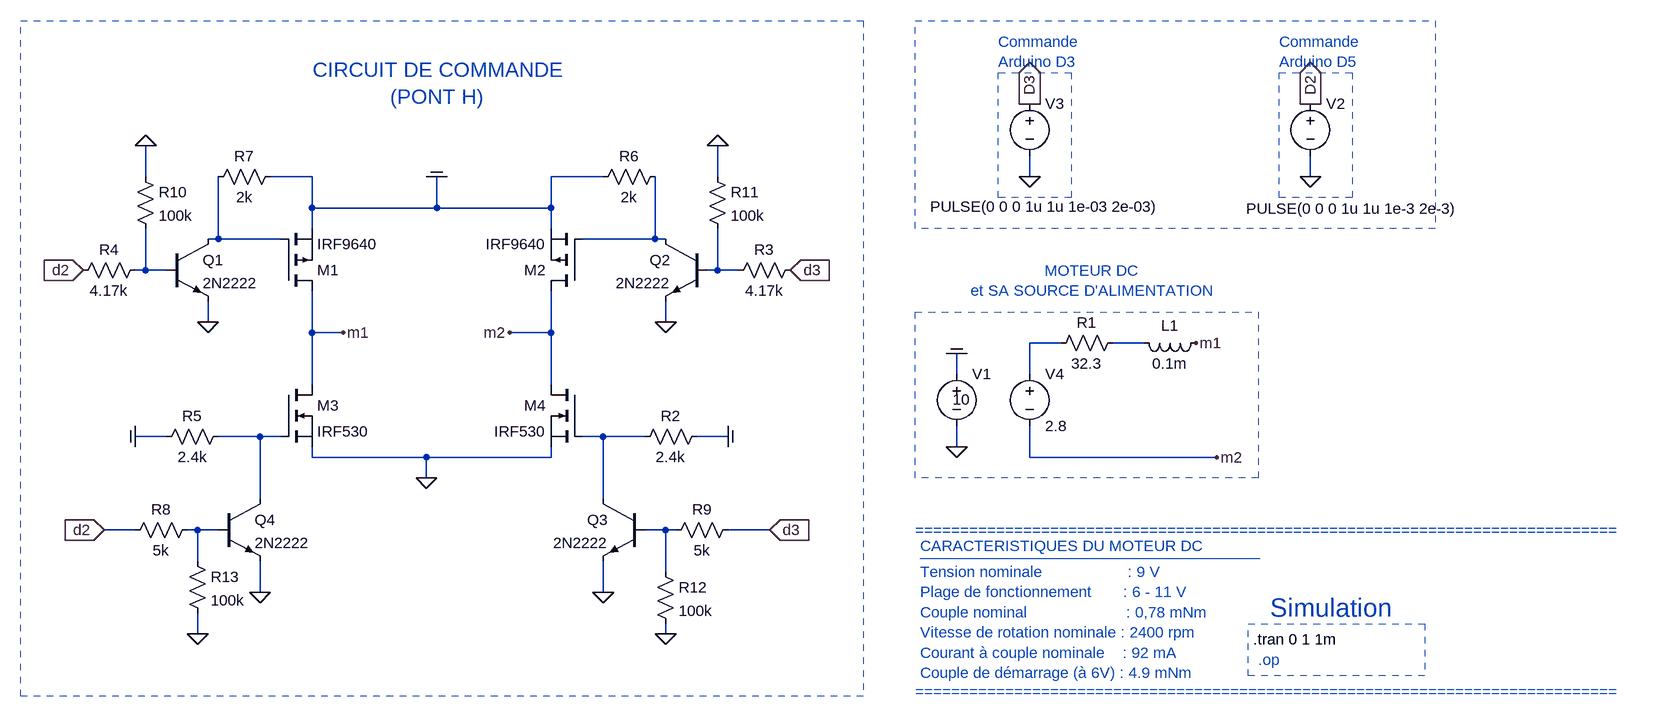
[diagram p0: schematic commande_moteur_DC_mosfet.asc]
commande_moteur_DC_mosfet.asc, the LTspice schematic file:
Version 4.1
SHEET 1 1636 1096
WIRE -432 -416 -432 -464
WIRE -176 -416 -240 -416
WIRE 272 -416 192 -416
WIRE 448 -416 448 -464
WIRE 928 -416 928 -448
WIRE 1360 -416 1360 -448
WIRE -176 -368 -176 -416
WIRE 16 -368 16 -416
WIRE 16 -368 -176 -368
WIRE 192 -368 192 -416
WIRE 192 -368 16 -368
WIRE -176 -336 -176 -368
WIRE 192 -336 192 -368
WIRE -320 -320 -320 -416
WIRE -320 -320 -336 -320
WIRE -224 -320 -320 -320
WIRE 352 -320 352 -416
WIRE 352 -320 240 -320
WIRE 368 -320 352 -320
WIRE -432 -272 -432 -336
WIRE -432 -272 -448 -272
WIRE -400 -272 -432 -272
WIRE 448 -272 448 -336
WIRE 448 -272 432 -272
WIRE 480 -272 448 -272
WIRE -336 -192 -336 -224
WIRE 368 -192 368 -224
WIRE -176 -176 -176 -240
WIRE -128 -176 -176 -176
WIRE 192 -176 192 -240
WIRE 192 -176 128 -176
WIRE 976 -160 928 -160
WIRE 1104 -160 1056 -160
WIRE 816 -112 816 -144
WIRE 928 -112 928 -160
WIRE -176 -96 -176 -176
WIRE 192 -96 192 -176
WIRE -400 -16 -448 -16
WIRE -256 -16 -320 -16
WIRE -224 -16 -256 -16
WIRE 272 -16 240 -16
WIRE 336 -16 272 -16
WIRE 464 -16 416 -16
WIRE 816 0 816 -32
WIRE -176 16 -176 0
WIRE 0 16 -176 16
WIRE 192 16 192 0
WIRE 192 16 0 16
WIRE 928 16 928 -32
WIRE 1216 16 928 16
WIRE 0 48 0 16
WIRE -256 80 -256 -16
WIRE 272 80 272 -16
WIRE -448 128 -496 128
WIRE -352 128 -368 128
WIRE -320 128 -352 128
WIRE 368 128 336 128
WIRE 384 128 368 128
WIRE 528 128 464 128
WIRE -352 176 -352 128
WIRE 368 192 368 128
WIRE -256 224 -256 176
WIRE 272 224 272 176
WIRE -352 288 -352 256
WIRE 368 288 368 272
FLAG 0 48 0
FLAG 816 0 0
FLAG 816 -144 COM
FLAG 16 -416 COM
FLAG -128 -176 m1
FLAG 128 -176 m2
FLAG 1184 -160 m1
FLAG 1216 16 m2
FLAG 1360 -416 0
FLAG 928 -416 0
FLAG 928 -528 D3
IOPIN 928 -528 Out
FLAG 1360 -528 D2
IOPIN 1360 -528 Out
FLAG -528 -272 d2
IOPIN -528 -272 In
FLAG 560 -272 d3
IOPIN 560 -272 In
FLAG -336 -192 0
FLAG 368 -192 0
FLAG -256 224 0
FLAG 272 224 0
FLAG 464 -16 COM
FLAG -448 -16 COM
FLAG 528 128 d3
IOPIN 528 128 In
FLAG -496 128 d2
IOPIN -496 128 In
FLAG -432 -464 0
FLAG 448 -464 0
FLAG -352 288 0
FLAG 368 288 0
SYMBOL nmos -224 -96 R0
SYMATTR InstName M3
SYMATTR Value IRF530
SYMBOL nmos 240 -96 M0
SYMATTR InstName M4
SYMATTR Value IRF530
SYMBOL voltage 816 -128 R0
WINDOW 3 -6 55 Left 2
WINDOW 123 0 0 Left 0
WINDOW 39 0 0 Left 0
SYMATTR Value 10
SYMATTR InstName V1
SYMBOL res 1072 -176 R90
WINDOW 0 0 56 VBottom 2
WINDOW 3 32 56 VTop 2
SYMATTR InstName R1
SYMATTR Value 32.3
SYMBOL ind 1200 -176 R90
WINDOW 0 5 56 VBottom 2
WINDOW 3 32 56 VTop 2
SYMATTR InstName L1
SYMATTR Value 0.1m
SYMBOL voltage 928 -128 R0
WINDOW 123 0 0 Left 0
WINDOW 39 0 0 Left 0
SYMATTR InstName V4
SYMATTR Value 2.8
SYMBOL voltage 1360 -544 R0
WINDOW 3 -99 177 Left 2
WINDOW 123 0 0 Left 0
WINDOW 39 0 0 Left 0
SYMATTR Value PULSE(0 0 0 1u 1u 1e-3 2e-3)
SYMATTR InstName V2
SYMBOL voltage 928 -544 R0
WINDOW 3 201 174 Right 2
WINDOW 123 0 0 Left 0
WINDOW 39 0 0 Left 0
SYMATTR Value PULSE(0 0 0 1u 1u 1e-03 2e-03)
SYMATTR InstName V3
SYMBOL res 576 -288 R90
WINDOW 0 0 56 VBottom 2
WINDOW 3 32 56 VTop 2
SYMATTR InstName R3
SYMATTR Value 4.17k
SYMBOL res -432 -288 R90
WINDOW 0 0 56 VBottom 2
WINDOW 3 32 56 VTop 2
SYMATTR InstName R4
SYMATTR Value 4.17k
SYMBOL pmos -224 -240 M180
SYMATTR InstName M1
SYMATTR Value IRF9640
SYMBOL pmos 240 -240 R180
SYMATTR InstName M2
SYMATTR Value IRF9640
SYMBOL npn -400 -320 R0
SYMATTR InstName Q1
SYMATTR Value 2N2222
SYMBOL npn 432 -320 M0
SYMATTR InstName Q2
SYMATTR Value 2N2222
SYMBOL res 368 -432 R90
WINDOW 0 0 56 VBottom 2
WINDOW 3 32 56 VTop 2
SYMATTR InstName R6
SYMATTR Value 2k
SYMBOL res -224 -432 R90
WINDOW 0 0 56 VBottom 2
WINDOW 3 32 56 VTop 2
SYMATTR InstName R7
SYMATTR Value 2k
SYMBOL res 432 -32 R90
WINDOW 0 0 56 VBottom 2
WINDOW 3 32 56 VTop 2
SYMATTR InstName R2
SYMATTR Value 2.4k
SYMBOL res -304 -32 R90
WINDOW 0 0 56 VBottom 2
WINDOW 3 32 56 VTop 2
SYMATTR InstName R5
SYMATTR Value 2.4k
SYMBOL npn 336 80 M0
SYMATTR InstName Q3
SYMATTR Value 2N2222
SYMBOL npn -320 80 R0
SYMATTR InstName Q4
SYMATTR Value 2N2222
SYMBOL res -352 112 R90
WINDOW 0 0 56 VBottom 2
WINDOW 3 32 56 VTop 2
SYMATTR InstName R8
SYMATTR Value 5k
SYMBOL res 480 112 R90
WINDOW 0 0 56 VBottom 2
WINDOW 3 32 56 VTop 2
SYMATTR InstName R9
SYMATTR Value 5k
SYMBOL res -448 -432 R0
SYMATTR InstName R10
SYMATTR Value 100k
SYMBOL res 432 -432 R0
SYMATTR InstName R11
SYMATTR Value 100k
SYMBOL res 352 176 R0
SYMATTR InstName R12
SYMATTR Value 100k
SYMBOL res -368 160 R0
SYMATTR InstName R13
SYMATTR Value 100k
TEXT 1312 -624 Left 2 ;Commande\nArduino D5
TEXT 880 -624 Left 2 ;Commande\nArduino D3
TEXT 760 152 Left 2 ;CARACTERISTIQUES DU MOTEUR DC
TEXT 760 160 Left 2 ;________________________________________
TEXT 760 192 Left 2 ;Tension nominale                   : 9 V\nPlage de fonctionnement       : 6 - 11 V\nCouple nominal                      : 0,78 mNm\nVitesse de rotation nominale : 2400 rpm\nCourant à couple nominale    : 92 mA\nCouple de démarrage (à 6V) : 4.9 mNm
TEXT 752 376 Left 2 ;==============================================================================
TEXT 1272 296 Left 2 !.tran 0 1 1m
TEXT 1280 328 Left 2 ;.op
TEXT 1392 248 Center 4 ;Simulation
TEXT 752 128 Left 2 ;==============================================================================
TEXT 1024 -256 Center 2 ;MOTEUR DC\net SA SOURCE D'ALIMENTATION
TEXT 16 -560 Center 3 ;CIRCUIT DE COMMANDE\n(PONT H)
RECTANGLE Normal 1424 -384 1312 -576 2
RECTANGLE Normal 992 -384 880 -576 2
RECTANGLE Normal 1280 48 752 -208 2
RECTANGLE Normal 1536 352 1264 272 2
RECTANGLE Normal 1552 -336 752 -656 2
RECTANGLE Normal -624 -656 672 384 2

The netlist it stands for:
* commande_moteur_DC_mosfet.asc
M3 m1 N007 0 0 IRF530
M4 m2 N008 0 0 IRF530
V1 COM 0 10
R1 N006 N005 32.3
L1 m1 N006 0.1m
V4 N005 m2 2.8
V2 D2 0 PULSE(0 0 0 1u 1u 1e-3 2e-3)
V3 D3 0 PULSE(0 0 0 1u 1u 1e-03 2e-03)
R3 D3 N004 4.17k
R4 N003 D2 4.17k
M1 m1 N001 COM COM IRF9640
M2 m2 N002 COM COM IRF9640
Q1 N001 N003 0 0 2N2222
Q2 N002 N004 0 0 2N2222
R6 N002 COM 2k
R7 COM N001 2k
R2 COM N008 2.4k
R5 N007 COM 2.4k
Q3 N008 N010 0 0 2N2222
Q4 N007 N009 0 0 2N2222
R8 N009 D2 5k
R9 D3 N010 5k
R10 0 N003 100k
R11 0 N004 100k
R12 N010 0 100k
R13 N009 0 100k
.model NPN NPN
.model PNP PNP
.lib standard.bjt
.model NMOS NMOS
.model PMOS PMOS
.lib standard.mos
* Commande
* Arduino D5
* Commande
* Arduino D3
* CARACTERISTIQUES DU MOTEUR DC
* ________________________________________
* Tension nominale                   : 9 V
* Plage de fonctionnement       : 6 - 11 V
* Couple nominal                      : 0,78 mNm
* Vitesse de rotation nominale : 2400 rpm
* Courant à couple nominale    : 92 mA
* Couple de démarrage (à 6V) : 4.9 mNm
* ==============================================================================
.tran 0 1 1m
* .op
* Simulation
* ==============================================================================
* MOTEUR DC
* et SA SOURCE D'ALIMENTATION
* CIRCUIT DE COMMANDE
* (PONT H)
.backanno
.end